# Altium schematic sheet PCL-02.SchDoc
size Tabloid; SheetNumber: 2; SheetTotal: 4
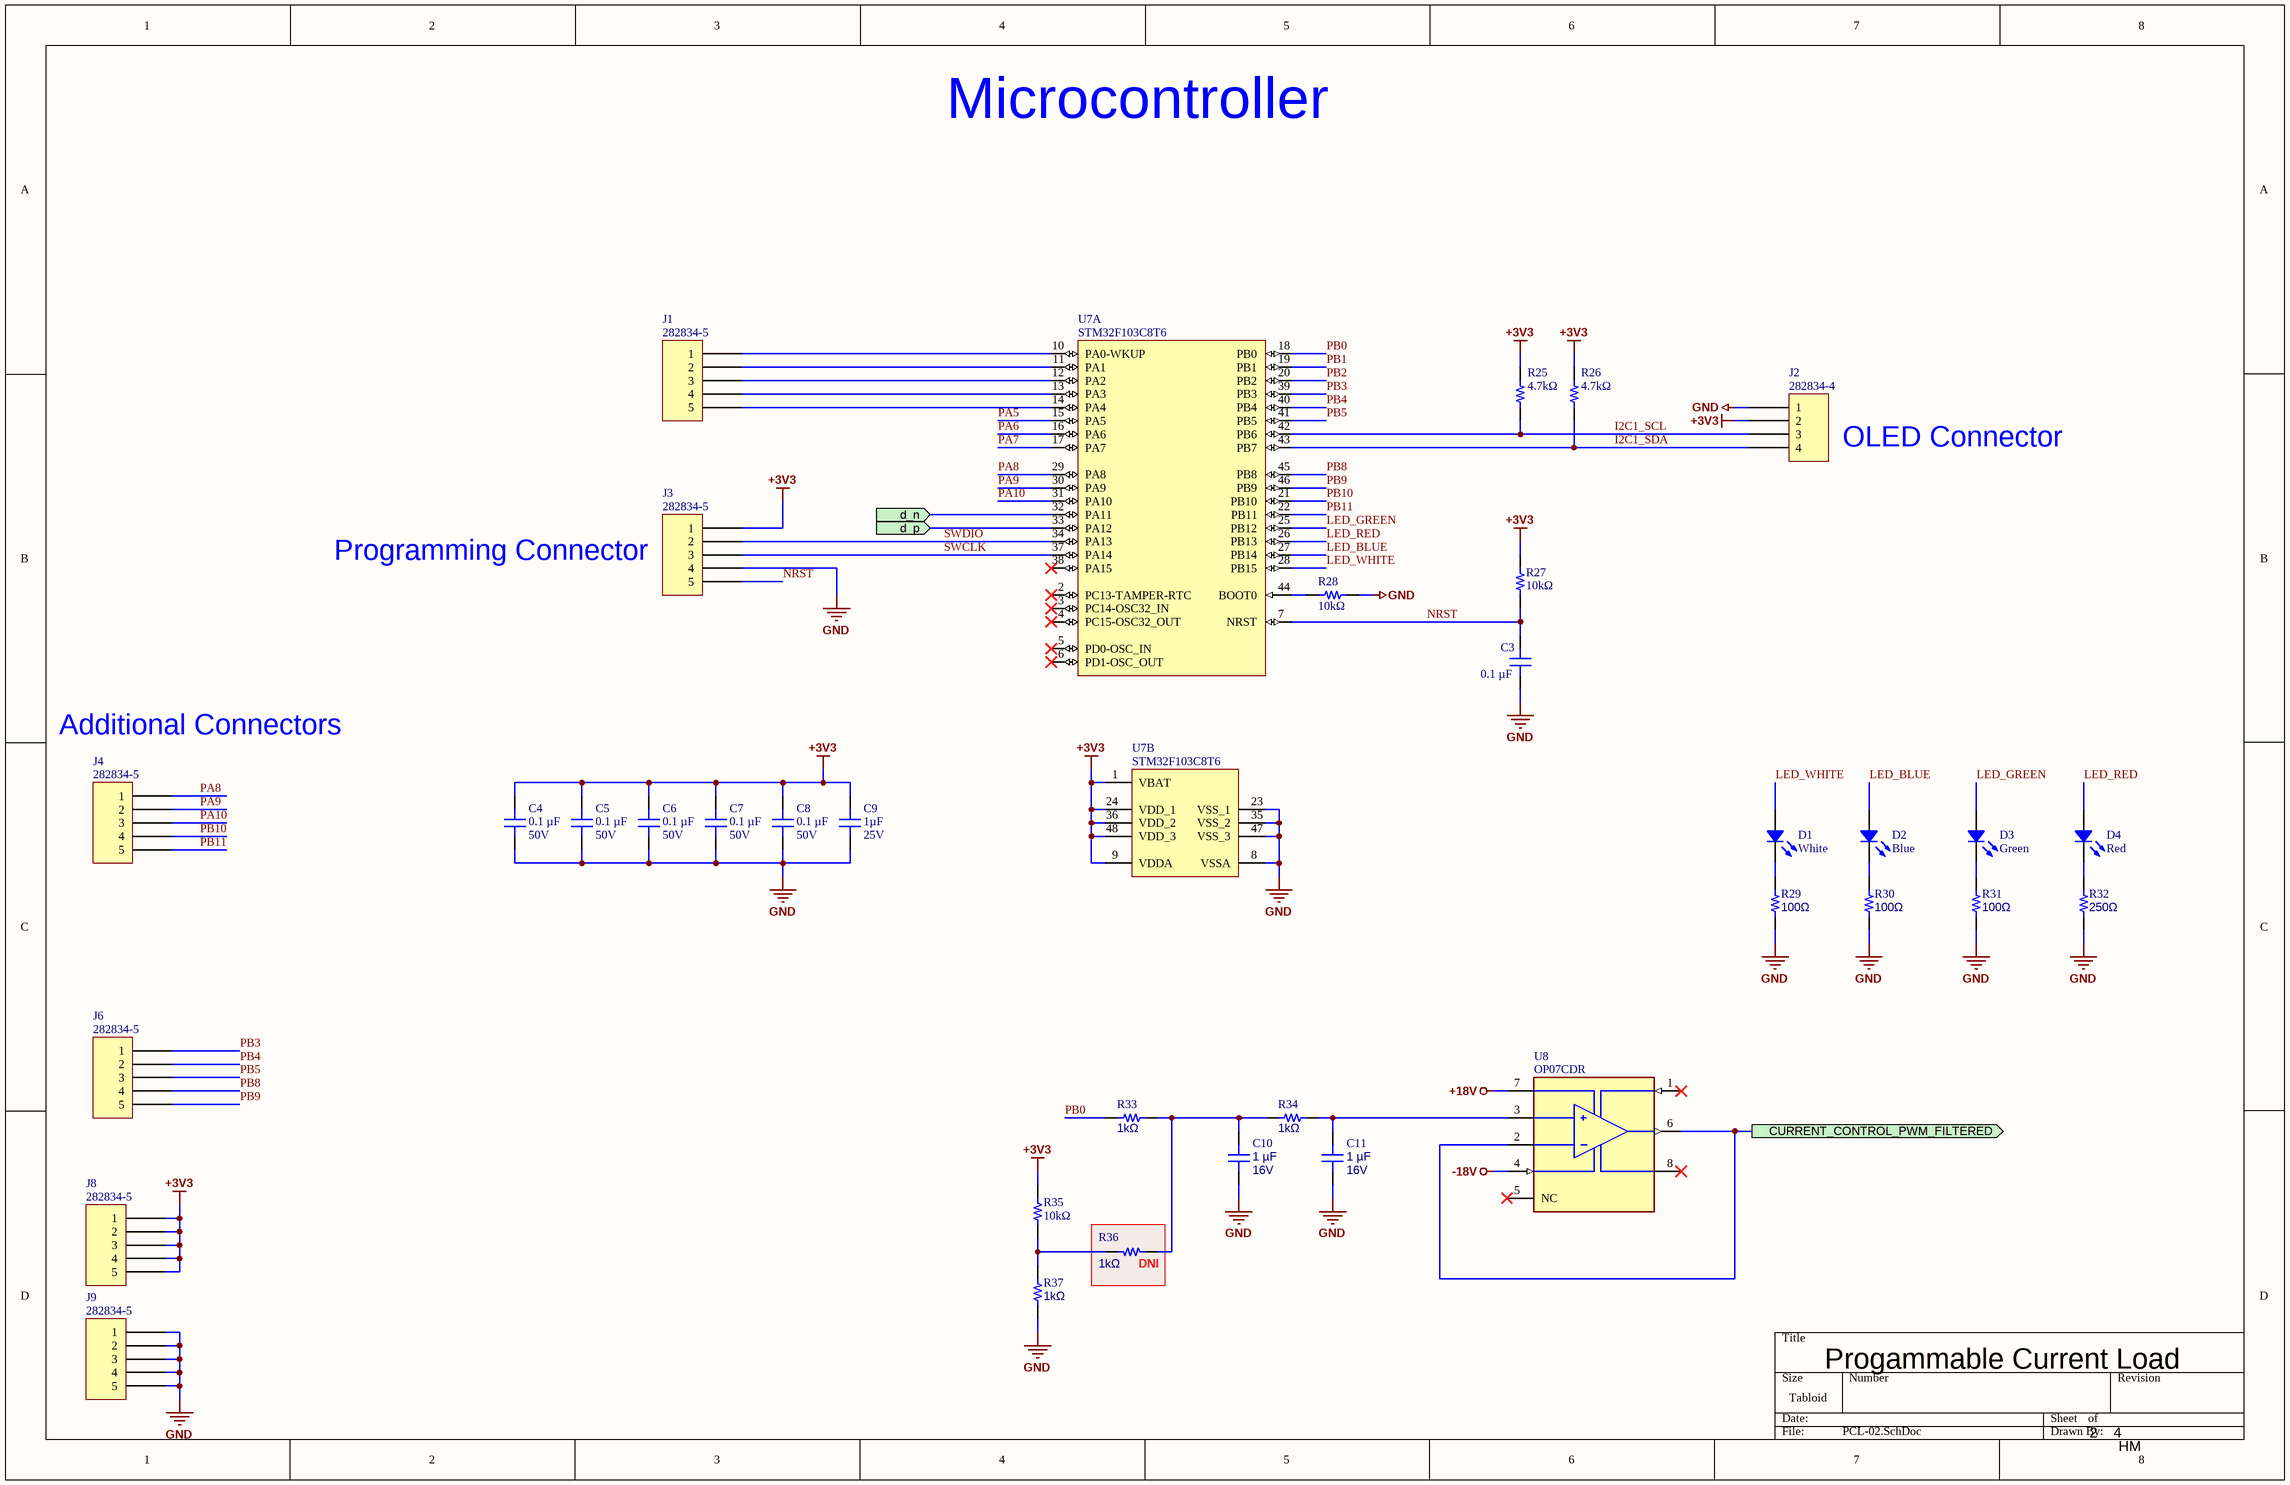
[diagram p0: PCL-02.SchDoc]

## Parts
C3  0.1 µF  [CAP 0603_1608]
C4  Voltage - Rated: 50V  [CAP 0603_1608]  (hidden comment: 0.1 µF)
C5  Voltage - Rated: 50V  [CAP 0603_1608]  (hidden comment: 0.1 µF)
C6  Voltage - Rated: 50V  [CAP 0603_1608]  (hidden comment: 0.1 µF)
C7  Voltage - Rated: 50V  [CAP 0603_1608]  (hidden comment: 0.1 µF)
C8  Voltage - Rated: 50V  [CAP 0603_1608]  (hidden comment: 0.1 µF)
C9  Voltage - Rated: 25V  [CAP 0805_2012]  (hidden comment: 1µF)
C10  Voltage - Rated: 16V  [CAP 0603_1608]  (hidden comment: 1 µF)
C11  Voltage - Rated: 16V  [CAP 0603_1608]  (hidden comment: 1 µF)
D1  White  [LED 0603_1608]
D2  Blue  [LED 0603_1608 BLUE]
D3  Green  [LED 0603_1608 GREEN]
D4  Red  [LED 0603_1608 RED]
J1  282834-5  [TE 282834-5]
J2  282834-4  [TE 282834-4]
J3  282834-5  [TE 282834-5]
J4  282834-5  [TE 282834-5]
J6  282834-5  [TE 282834-5]
J8  282834-5  [TE 282834-5]
J9  282834-5  [TE 282834-5]
R25  4.7kΩ  [RES 0603_1608]
R26  4.7kΩ  [RES 0603_1608]
R27  10kΩ  [RES 0603_1608]
R28  10kΩ  [RES 0603_1608]
R29  100Ω  [RES 0603_1608]
R30  100Ω  [RES 0603_1608]
R31  100Ω  [RES 0603_1608]
R32  250Ω  [RES 0603_1608]
R33  1kΩ  [RES 0603_1608]
R34  1kΩ  [RES 0603_1608]
R35  10kΩ  [RES 0603_1608]
R36  1kΩ  [RES 0603_1608]
R37  1kΩ  [RES 0603_1608]
U7  STM32F103C8T6  [STM-LQFP48_L]  (parts A,B of 2)
U8  OP07CDR  [FP-D0008A-MFG]

## Blocks framed on the sheet
DNI: R36

## Ports
CURRENT_CONTROL_PWM_FILTERED (out, see PCL-01[2A]), d_n (in, see PCL-04[6B]), d_p (in, see PCL-04[6B])

## Nets
+3V3: C4.2 C5.2 C6.2 C7.2 C8.2 C9.2 J2.2 J3.1 J8.1 J8.2 J8.3 J8.4 J8.5 R25.2 R26.2 R27.2 R35.2 U7.1(VBAT) U7.9(VDDA) U7.24(VDD_1) U7.36(VDD_2) U7.48(VDD_3)
+18V: U8.7(VCC+)
-18V: U8.4(VCC-)
GND: C3.1 C4.1 C5.1 C6.1 C7.1 C8.1 C9.1 C10.1 C11.1 J2.1 J3.4 J9.1 J9.2 J9.3 J9.4 J9.5 R28.1 R29.1 R30.1 R31.1 R32.1 R37.1 U7.8(VSSA) U7.23(VSS_1) U7.35(VSS_2) U7.47(VSS_3)
CURRENT_CONTROL_PWM_FILTERED: U8.2(IN-) U8.6(OUT) ; port CURRENT_CONTROL_PWM_FILTERED
d_n: U7.32(PA11) ; port d_n
d_p: U7.33(PA12) ; port d_p
I2C1_SCL: J2.3 R25.1 U7.42(PB6)
I2C1_SDA: J2.4 R26.1 U7.43(PB7)
LED_BLUE: D2.1 U7.27(PB14)
LED_GREEN: D3.1 U7.25(PB12)
LED_RED: D4.1 U7.26(PB13)
LED_WHITE: D1.1 U7.28(PB15)
NRST: C3.2 J3.5 R27.1 U7.7(NRST)
PA5: U7.15(PA5)
PA6: U7.16(PA6)
PA7: U7.17(PA7)
PA8: J4.1 U7.29(PA8)
PA9: J4.2 U7.30(PA9)
PA10: J4.3 U7.31(PA10)
PB0: R33.1 U7.18(PB0)
PB1: U7.19(PB1)
PB2: U7.20(PB2)
PB3: J6.1 U7.39(PB3)
PB4: J6.2 U7.40(PB4)
PB5: J6.3 U7.41(PB5)
PB8: J6.4 U7.45(PB8)
PB9: J6.5 U7.46(PB9)
PB10: J4.4 U7.21(PB10)
PB11: J4.5 U7.22(PB11)
SWCLK: J3.3 U7.37(PA14)
SWDIO: J3.2 U7.34(PA13)
NetC10_2: C10.2 R33.2 R34.1 R36.2
NetC11_2: C11.2 R34.2 U8.3(IN+)
NetD1_2: D1.2 R29.2
NetD2_2: D2.2 R30.2
NetD3_2: D3.2 R31.2
NetD4_2: D4.2 R32.2
NetJ1_1: J1.1 U7.10(PA0-WKUP)
NetJ1_2: J1.2 U7.11(PA1)
NetJ1_3: J1.3 U7.12(PA2)
NetJ1_4: J1.4 U7.13(PA3)
NetJ1_5: J1.5 U7.14(PA4)
NetR28_2: R28.2 U7.44(BOOT0)
NetR35_1: R35.1 R36.1 R37.2

Not connected (* = marked no-connect by the designer): U7 2(PC13-TAMPER-RTC)* 3(PC14-OSC32_IN)* 4(PC15-OSC32_OUT)* 5(PD0-OSC_IN)* 6(PD1-OSC_OUT)* 38(PA15)*; U8 1(OFFSET_N1)* 5(NC)* 8*

## Notes on the sheet
- Microcontroller
- OLED Connector
- Programming Connector
- Additional Connectors
- Progammable Current Load
- 2
- 4
- HM

## Library data of the parts
C3-C8 = C0603C104K5RAC7411: CAP CER 0.1UF 50V X7R 0603; manufacturer: KEMET; Tolerance: ±10%; Part Number: C0603C104K5RAC7411; Capacitance: 0.1 µF; Applications: Bypass, Decoupling; componentlink1description: Datasheet; componentlink1url: https://api.kemet.com/component-edge/download/datasheet/C0603C104K5RAC7411.pdf; componentlink2description: DigiKey Link; componentlink2url: https://www.digikey.com/en/products/detail/kemet/C0603C104K5RAC7411/3317013; Device Package: 0603 (1608 Metric); lastupdated: 2026-04-06 7:23:52 PM; Lifecycle Status: Active; Minimum Order: 1; Mounting Type: Surface Mount, MLCC; Operating Temperature: -55°C ~ 125°C; Package / Case: 0603 (1608 Metric); packaging: TapeAndReel; partid: 2233; Part Status: Active; price: 0.01; series: SMD Comm X7R; Size / Dimension: 0.063" L x 0.031" W (1.60mm x 0.80mm); Supplier 1: DigiKey; Supplier Part Number 1: 399-C0603C104K5RAC7411CT-ND; Temperature Coefficient: X7R; Thickness (Max): 0.035" (0.90mm); value: 0.1 µF
  C3: Voltage - Rated: 50V
C9 = 08053D105KAT2A: CAP CER 1UF 25V X5R 0805; manufacturer: AVX Corporation; Tolerance: ±10%; Part Number: 08053D105KAT2A; Capacitance: 1µF; Applications: General Purpose; componentlink1description: Datasheet; componentlink1url: http://datasheets.avx.com/cx5r.pdf; componentlink2description: DigiKey Link; componentlink2url: http://digikey.com/product-detail/en/avx-corporation/08053D105KAT2A/478-1409-1-ND/564441; Device Package: 0805 (2012 Metric); lastupdated: 2020-09-02 1:04:40 AM; Lifecycle Status: Active; Minimum Order: 1; Mounting Type: Surface Mount, MLCC; Operating Temperature: -55°C ~ 85°C; Package / Case: 0805 (2012 Metric); packaging: TapeAndReel; partid: 3127; Part Status: Active; price: 0.12; series: -; Size / Dimension: 0.079" L x 0.049" W (2.01mm x 1.25mm); Supplier 1: DigiKey; Supplier Part Number 1: 478-1409-1-ND; Temperature Coefficient: X5R; Thickness (Max): 0.055" (1.40mm); value: 1µF
C10 C11 = C0603C105K4RACAUTO: CAP CER 1UF 16V X7R 0603; manufacturer: KEMET; Tolerance: ±10%; Part Number: C0603C105K4RACAUTO; Capacitance: 1 µF; Applications: Automotive, Bypass, Decoupling; componentlink1description: Datasheet; componentlink1url: https://api.kemet.com/component-edge/download/datasheet/C0603C105K4RACAUTO.pdf; componentlink2description: DigiKey Link; componentlink2url: https://www.digikey.com/en/products/detail/kemet/C0603C105K4RACAUTO/8635831; Device Package: 0603 (1608 Metric); lastupdated: 2026-04-06 7:23:53 PM; Lifecycle Status: Active; Minimum Order: 1; Mounting Type: Surface Mount, MLCC; Operating Temperature: -55°C ~ 125°C; Package / Case: 0603 (1608 Metric); packaging: TapeAndReel; partid: 2179; Part Status: Active; price: 0.02; Ratings: AEC-Q200; series: SMD Auto X7R; Size / Dimension: 0.063" L x 0.031" W (1.60mm x 0.80mm); Supplier 1: DigiKey; Supplier Part Number 1: 399-17704-1-ND; Temperature Coefficient: X7R; Thickness (Max): 0.037" (0.95mm); value: 1 µF
D1 = 5973905607F: LED WHITE 0603 SMD; Manufacturer: Dialight; Configuration: Standard; Current - Test: 5mA; Lens Color: 0.45mm; Lens Size: 1.20mm x 0.80mm; Lens Style: Rectangle with Flat Top; Viewing Angle: 130°; Voltage - Forward (Vf) (Typ): 2.925V; Part Number: 5973905607F; Color: White; ComponentLink2Description: DigiKey Link; ComponentLink2URL: https://www.digikey.com/en/products/detail/dialight/5973905607F/9385450; Device Package: 0603 (1608 Metric); Height (Max): 0.45mm; LastUpdated: 2026-04-05 8:43:50 PM; Lifecycle Status: Active; Minimum Order: 1; Mounting Type: Surface Mount; Package / Case: 0603 (1608 Metric); Packaging: TapeAndReel; PartId: 883; Part Status: Active; Price: 0.09; Series: 597; Size / Dimension: 1.60mm L x 0.80mm W; Supplier 1: DigiKey; Supplier Part Number 1: 350-4395-1-ND; Supplier Device Package: 0603; Value: White
D2 = VLMB1300-GS08: LED BLUE 0603 SMD; Manufacturer: Vishay Semiconductor Opto Division; Configuration: Standard; Current - Test: 20mA; Lens Color: 1.00mm; Lens Size: 1.10mm x 0.80mm; Lens Style: Rectangle with Flat Top; Millicandela Rating: 104mcd; Viewing Angle: 130°; Voltage - Forward (Vf) (Typ): 3.3V; Wavelength - Dominant: 470nm; Wavelength - Peak: 468nm; Part Number: VLMB1300-GS08; Color: Blue; ComponentLink1Description: Datasheet; ComponentLink1URL: http://www.vishay.com/docs/82437/vlmo1300.pdf; ComponentLink2Description: DigiKey Link; ComponentLink2URL: https://www.digikey.com/en/products/detail/vishay-semiconductor-opto-division/VLMB1300-GS08/3025494; Device Package: 0603 (1608 Metric); Height (Max): 1.00mm; LastUpdated: 2026-04-05 8:35:04 PM; Lifecycle Status: Active; Minimum Order: 1; Mounting Type: Surface Mount; Package / Case: 0603 (1608 Metric); Packaging: TapeAndReel; PartId: 785; Part Status: Active; Price: 0.06; Series: CHIPLED; Size / Dimension: 1.60mm L x 0.80mm W; Supplier 1: DigiKey; Supplier Part Number 1: VLMB1300-GS08CT-ND; Supplier Device Package: 0603; Value: Blue
D3 = SM0603GCL: LED GREEN CLEAR 0603 SMD; Manufacturer: Bivar Inc.; Configuration: Standard; Current - Test: 2mA; Lens Color: Colorless; Lens Size: 1.00mm x 0.80mm; Lens Style: Rectangle with Flat Top; Millicandela Rating: 3.6mcd; Viewing Angle: 130°; Voltage - Forward (Vf) (Typ): 1.9V; Wavelength - Dominant: 574nm; Wavelength - Peak: 575nm; Part Number: SM0603GCL; Color: Green; ComponentLink1Description: Datasheet; ComponentLink1URL: https://www.bivar.com/Files/Datasheets/SM0603GCL.pdf; ComponentLink2Description: DigiKey Link; ComponentLink2URL: https://www.digikey.com/en/products/detail/bivar-inc/SM0603GCL/3095514; Device Package: 0603 (1608 Metric); Height (Max): 0.60mm; LastUpdated: 2026-04-05 8:36:38 PM; Lens Transparency: Clear; Lifecycle Status: Active; Minimum Order: 1; Mounting Type: Surface Mount; Package / Case: 0603 (1608 Metric); Packaging: TapeAndReel; PartId: 622; Part Status: Active; Price: 0.19; Series: -; Size / Dimension: 1.60mm L x 0.80mm W; Supplier 1: DigiKey; Supplier Part Number 1: 492-2523-1-ND; Supplier Device Package: 0603; Value: Green
D4 = 5973005507F: LED RED 0603 SMD; Manufacturer: Dialight; Configuration: Standard; Current - Test: 20mA; Lens Color: 0.68mm; Lens Size: 1.20mm x 0.80mm; Lens Style: Rectangle with Flat Top; Millicandela Rating: 90mcd; Voltage - Forward (Vf) (Typ): 2V; Wavelength - Dominant: 630nm; Part Number: 5973005507F; Color: Red; ComponentLink1Description: Datasheet; ComponentLink1URL: http://www.dialightsignalsandcomponents.com/Assets/Drawings/2D_Drawings_DrawingDetailedSpec/NewDrawings/18369A.pdf; ComponentLink2Description: DigiKey Link; ComponentLink2URL: https://www.digikey.com/en/products/detail/dialight/5973005507F/9385429; Device Package: 0603 (1608 Metric); Height (Max): 0.68mm; LastUpdated: 2026-04-05 8:38:00 PM; Lifecycle Status: Active; Minimum Order: 1; Mounting Type: Surface Mount; Package / Case: 0603 (1608 Metric); Packaging: TapeAndReel; PartId: 378; Part Status: Active; Price: 0.09; Series: 597; Size / Dimension: 1.60mm L x 0.80mm W; Supplier 1: DigiKey; Supplier Part Number 1: 350-4374-1-ND; Supplier Device Package: 0603; Value: Red
J1 J3 J4 J6 J8 J9 = 282834-5: TERM BLK 5P SIDE ENT 2.54MM PCB; Manufacturer: TE Connectivity AMP Connectors; Current: 10A; Mating Orientation: Horizontal with Board; Number of Levels: 1; Pitch: 0.100" (2.54mm); Positions Per Level: 5; Voltage: 150V; Wire Gauge: 16-30 AWG; Wire Termination: Screw - Rising Cage Clamp; Part Number: 282834-5; Color: Green; ComponentLink1Description: Datasheet; ComponentLink1URL: https://www.te.com/commerce/DocumentDelivery/DDEController?Action=srchrtrv&DocNm=282834&DocType=Customer+Drawing&DocLang=English; ComponentLink2Description: DigiKey Link; ComponentLink2URL: http://digikey.com/product-detail/en/te-connectivity-amp-connectors/282834-5/A98336-ND/1153266; LastUpdated: 2020-01-15 4:16:19 AM; Lifecycle Status: Active; Minimum Order: 1; Mounting Type: Through Hole; Packaging: Bulk; Part Status: Active; Price: 2.99; Series: Buchanan; Supplier 1: DigiKey; Supplier Part Number 1: A98336-ND
J2 = 282834-4: TERM BLK 4P SIDE ENT 2.54MM PCB; Manufacturer: TE Connectivity AMP Connectors; Current: 10A; Mating Orientation: Horizontal with Board; Number of Levels: 1; Pitch: 0.100" (2.54mm); Positions Per Level: 4; Voltage: 150V; Wire Gauge: 16-30 AWG; Wire Termination: Screw - Rising Cage Clamp; Part Number: 282834-4; Color: Green; ComponentLink1Description: Datasheet; ComponentLink1URL: https://www.te.com/commerce/DocumentDelivery/DDEController?Action=srchrtrv&DocNm=282834&DocType=Customer+Drawing&DocLang=English; ComponentLink2Description: DigiKey Link; ComponentLink2URL: http://digikey.com/product-detail/en/te-connectivity-amp-connectors/282834-4/A98335-ND/1153265; LastUpdated: 2020-01-15 4:16:05 AM; Lifecycle Status: Active; Minimum Order: 1; Mounting Type: Through Hole; Packaging: Bulk; Part Status: Active; Price: 2.68; Series: Buchanan; Supplier 1: DigiKey; Supplier Part Number 1: A98335-ND
R25 R26 = RMCF0603FT4K70: RES 4.7K OHM 1% 1/10W 0603; Manufacturer: Stackpole Electronics Inc; Value: 4.7 kOhms; Power (Watts): 0.1W, 1/10W; Temperature Coefficient: ±100ppm/°C; Part Number: RMCF0603FT4K70; ComponentLink1Description: Datasheet; ComponentLink1URL: https://www.seielect.com/catalog/sei-rmcf_rmcp.pdf; ComponentLink2Description: DigiKey Link; ComponentLink2URL: https://www.digikey.com/en/products/detail/stackpole-electronics-inc/RMCF0603FT4K70/1760998; Composition: Thick Film; Device Package: 0603 (1608 Metric); Features: Automotive AEC-Q200; Height - Seated (Max): 0.022" (0.55mm); LastUpdated: 2024-02-09 8:43:32 PM; Lifecycle Status: Active; Minimum Order: 1; Number of Terminations: 2; Operating Temperature: -55°C ~ 155°C; Package / Case: 0603 (1608 Metric); Packaging: CutTape; PartId: 6078; Part Status: Active; Price: 0.01; Ratings: AEC-Q200; Resistance: 4.7 kOhms; Series: RMCF; Size / Dimension: 0.061" L x 0.031" W (1.55mm x 0.80mm); Supplier 1: DigiKey; Supplier Part Number 1: RMCF0603FT4K70CT-ND; Supplier Device Package: 0603; Tolerance: ±1%
R27 R28 R35 = RT0603FRE0710KL: RES SMD 10K OHM 1% 1/10W 0603; Manufacturer: Yageo; Value: 10 kOhms; Power (Watts): 0.1W, 1/10W; Temperature Coefficient: ±50ppm/°C; Part Number: RT0603FRE0710KL; ComponentLink1Description: Datasheet; ComponentLink1URL: https://www.yageo.com/upload/media/product/productsearch/datasheet/rchip/PYu-RT_1-to-0.01_RoHS_L_11.pdf; ComponentLink2Description: DigiKey Link; ComponentLink2URL: https://www.digikey.com/en/products/detail/yageo/RT0603FRE0710KL/1075040; Composition: Thin Film; Device Package: 0603 (1608 Metric); Height - Seated (Max): 0.022" (0.55mm); LastUpdated: 2026-04-06 7:44:01 PM; Lifecycle Status: Active; Minimum Order: 1; Number of Terminations: 2; Operating Temperature: -55°C ~ 155°C; Package / Case: 0603 (1608 Metric); Packaging: TapeAndReel; PartId: 5671; Part Status: Active; Price: 0.01; Resistance: 10 kOhms; Series: RT; Size / Dimension: 0.063" L x 0.031" W (1.60mm x 0.80mm); Supplier 1: DigiKey; Supplier Part Number 1: YAG2321CT-ND; Supplier Device Package: 0603; Tolerance: ±1%
R29-R31 = RP73PF1J100RBTDF: RES SMD 100 OHM 0.1% 1/6W 0603; Manufacturer: TE Connectivity Passive Product; Power (Watts): 0.167W, 1/6W; Resistance: 100 Ohms; Temperature Coefficient: ±25ppm/°C; Part Number: RP73PF1J100RBTDF; Value: 100Ω; ComponentLink1Description: Datasheet; ComponentLink1URL: https://www.te.com/commerce/DocumentDelivery/DDEController?Action=srchrtrv&DocNm=1773272&DocType=DS&DocLang=English; ComponentLink2Description: DigiKey Link; ComponentLink2URL: https://www.digikey.com/en/products/detail/te-connectivity-passive-product/RP73PF1J100RBTDF/4033480; Composition: Thin Film; Device Package: 0603 (1608 Metric); Height - Seated (Max): 0.022" (0.55mm); LastUpdated: 2024-02-09 8:43:33 PM; Lifecycle Status: Active; Minimum Order: 1; Number of Terminations: 2; Operating Temperature: -55°C ~ 155°C; Package / Case: 0603 (1608 Metric); Packaging: TapeAndReel; PartId: 5814; Part Status: Active; Price: 0.14; Series: RP73, Holsworthy; Size / Dimension: 0.061" L x 0.031" W (1.55mm x 0.80mm); Supplier 1: DigiKey; Supplier Part Number 1: A110012CT-ND; Supplier Device Package: 0603; Tolerance: ±0.1%
R32 = CH0603-250RJNTA: RES 250 OHM 5% 1/8W 0603; Manufacturer: Vishay Sfernice; Power (Watts): 0.125W, 1/8W; Resistance: 250 Ohms; Temperature Coefficient: ±100ppm/°C; Part Number: CH0603-250RJNTA; Value: 250Ω; ComponentLink1Description: Datasheet; ComponentLink1URL: http://www.vishay.com/docs/53014/ch.pdf; ComponentLink2Description: DigiKey Link; ComponentLink2URL: https://www.digikey.com/en/products/detail/vishay-sfernice/CH0603-250RJNTA/9405751; Composition: Thin Film; Device Package: 0603 (1608 Metric); Features: RF, High Frequency; Height - Seated (Max): 0.025" (0.63mm); LastUpdated: 2024-02-09 8:43:16 PM; Lifecycle Status: Active; Minimum Order: 1; Number of Terminations: 2; Operating Temperature: -55°C ~ 155°C; Package / Case: 0603 (1608 Metric); Packaging: TapeAndReel; PartId: 10119; Part Status: Active; Price: 2.39; Series: CH; Size / Dimension: 0.060" L x 0.030" W (1.52mm x 0.76mm); Supplier 1: DigiKey; Supplier Part Number 1: 716-1168-1-ND; Supplier Device Package: 0603; Tolerance: ±5%
R33 R34 R36 R37 = CRCW06031K00FKEB: RES SMD 1K OHM 1% 1/10W 0603; Manufacturer: Vishay Dale; Power (Watts): 0.1W, 1/10W; Resistance: 1 kOhms; Temperature Coefficient: ±100ppm/°C; Part Number: CRCW06031K00FKEB; Value: 1kΩ; ComponentLink1Description: Datasheet; ComponentLink1URL: http://www.vishay.com/docs/20035/dcrcwe3.pdf; ComponentLink2Description: DigiKey Link; ComponentLink2URL: https://www.digikey.com/en/products/detail/vishay-dale/CRCW06031K00FKEB/5071169; Composition: Thick Film; Device Package: 0603 (1608 Metric); Features: Automotive AEC-Q200; Height - Seated (Max): 0.020" (0.50mm); LastUpdated: 2024-02-09 8:43:36 PM; Lifecycle Status: Active; Minimum Order: 1; Number of Terminations: 2; Operating Temperature: -55°C ~ 155°C; Package / Case: 0603 (1608 Metric); Packaging: CutTape; PartId: 5123; Part Status: Active; Price: 0.01; Ratings: AEC-Q200; Series: CRCW; Size / Dimension: 0.063" L x 0.033" W (1.60mm x 0.85mm); Supplier 1: DigiKey; Supplier Part Number 1: 541-2985-1-ND; Supplier Device Package: 0603; Tolerance: ±1%
U7 = CMP-0237-00215-3: ARM Cortex-M3 32-bit MCU, 64 KB Flash, 20 KB Internal RAM, 37 I/Os, 48-pin LQFP, -40 to 85 degC, Tray; Supply Voltage(Vcc) min (V): 2; Internal RAM Size (kB): 20; FLASH Size (Prog) (kB): 64; A/D Converter: 2x12-bit (10 Channel); I/Os (High Current): 37; Operating Frequency(F) (Processor speed) (MHz): 72; Core: ARM Cortex-M3; ComponentLink3Description: Package Specification; Mounting Technology: Surface Mount; PartNumber: STM32F103C8T6; PackageReference: LQFP48; Packing: Tray; ComponentLink3URL: http://www.st.com/st-web-ui/static/active/en/resource/technical/document/datasheet/DM00058181.pdf; DatasheetVersion: Rev. 16; ComponentLink1URL: http://www.st.com/web/en/home.html; PackageVersion: Rev. 6, 06/2013; ComponentLink2URL: http://www.st.com/st-web-ui/static/active/en/resource/technical/document/datasheet/CD00161566.pdf; ComponentLink1Description: Manufacturer URL; ComponentLink2Description: Datasheet; PackageDescription: 48-Pin Low Profile Quad Flat Package, 7 x 7 mm Body, 0.5 mm Pitch
U8 = CMP-0015-00070-3: IC OPAMP GP 1 CIRCUIT 8SOIC; Number of Circuits: 1; Dual Supply Voltage: 9V; Max I/O Voltage: 150uV; Max Dual Supply Voltage: 18V; Nominal Supply Current: 5mA; Bandwidth: 600kHz; Slew Rate: 0.3V/µs; Input Bias Current: 7nA; Min Dual Supply Voltage: 3V; Common Mode Rejection Ratio: 100dB; Voltage Gain: 112.04dB; Packaging: Tape and Reel; Min Operating Temperature: 0°C; REACH SVHC: No SVHC; Operating Supply Voltage: 18V; Package Quantity: 1; Number of Channels: 1; Number of Pins: 8; Number of Elements: 1; Lead Free: Lead Free; Gain Bandwidth Product: 600kHz; Nominal Gain Bandwidth Product: 600kHz; Unity Gain Bandwidth Product: 600kHz; Width: 3.91mm; Case/Package: D; Radiation Hardening: No; Input Offset Voltage (Vos): 150uV; Height: 1.58mm; Length: 4.9mm; Max Operating Temperature: 70°C; Number of Amplifiers: 1